# Altium schematic sheet a0206-2006.11.SchDoc
size 558 x 431 mm
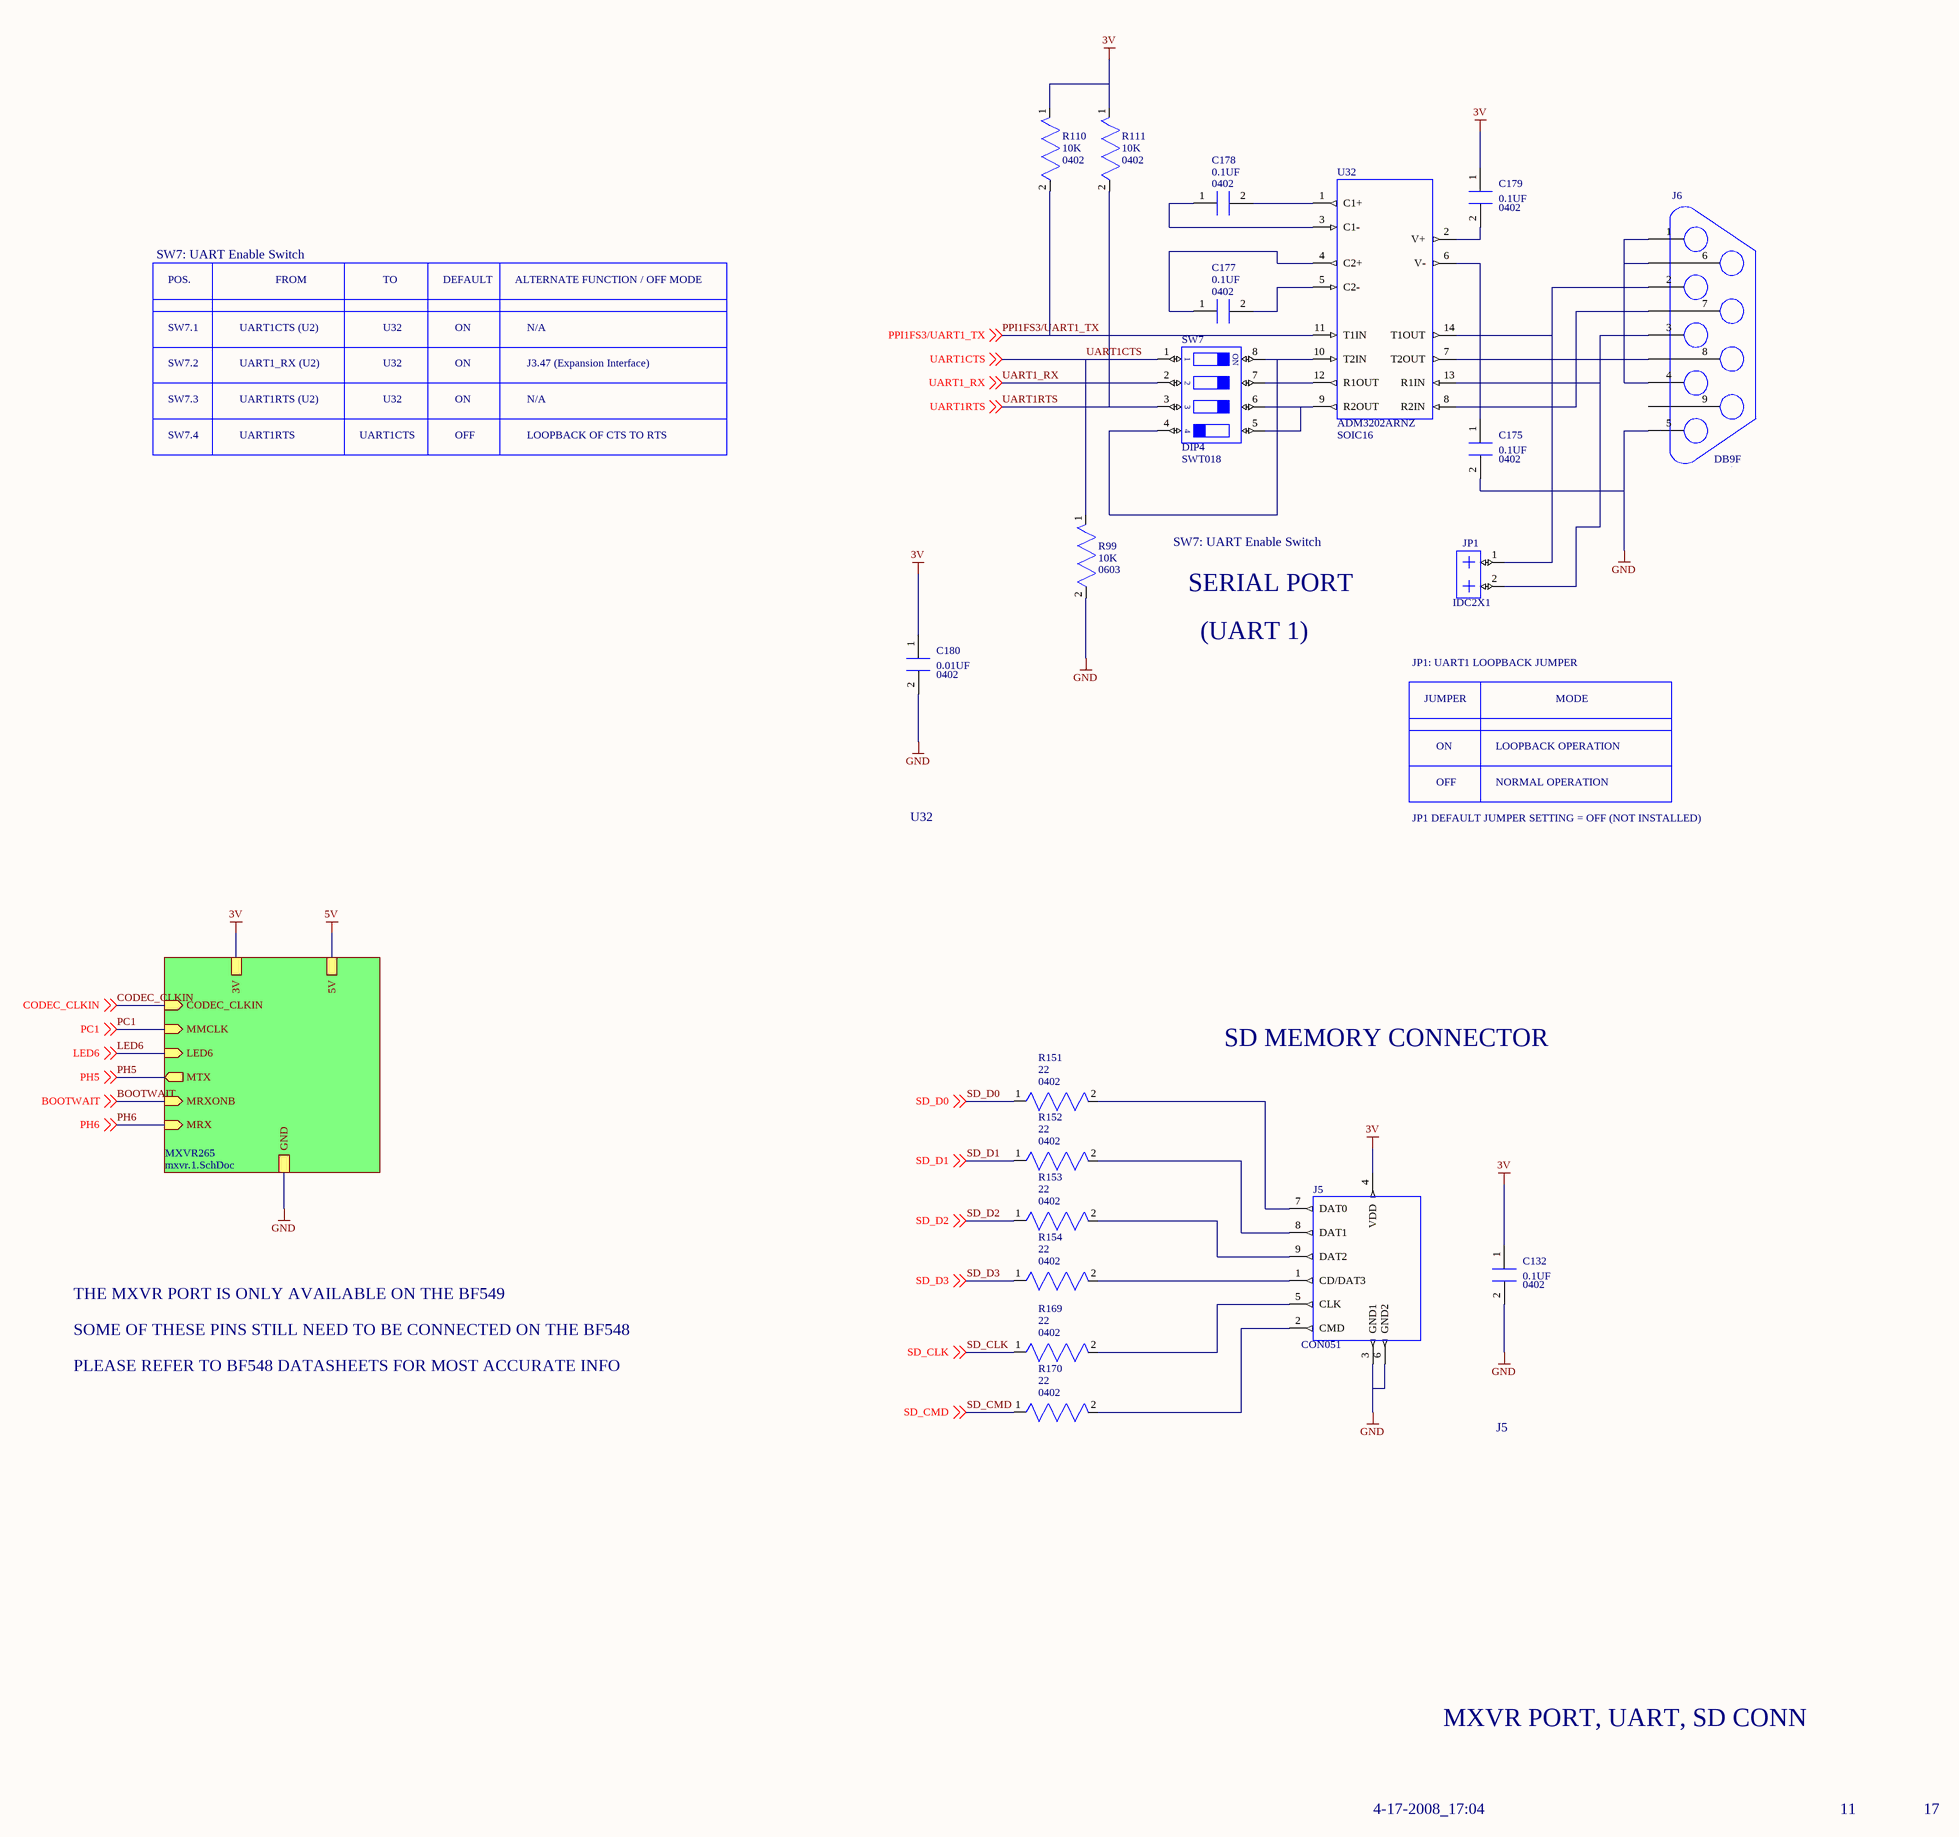
[diagram p0: a0206-2006.11.SchDoc]

## Parts
C132  value 0.1UF  [0402]  (hidden comment: *)
C175  value 0.1UF  [0402]  (hidden comment: *)
C177  value 0.1UF  [0402]  (hidden comment: *)
C178  value 0.1UF  [0402]  (hidden comment: *)
C179  value 0.1UF  [0402]  (hidden comment: *)
C180  value 0.01UF  [0402]  (hidden comment: *)
J5  *  [CON051]  (value not drawn)
J6  *  [DB9F]  (value not drawn)
JP1  *  [IDC2X1]  (value not drawn)
R99  value 10K  [0603]  (hidden comment: *)
R110  value 10K  [0402]  (hidden comment: *)
R111  value 10K  [0402]  (hidden comment: *)
R151  value 22  [0402]  (hidden comment: *)
R152  value 22  [0402]  (hidden comment: *)
R153  value 22  [0402]  (hidden comment: *)
R154  value 22  [0402]  (hidden comment: *)
R169  value 22  [0402]  (hidden comment: *)
R170  value 22  [0402]  (hidden comment: *)
SW7  value DIP4  [SWT018]  (hidden comment: *)
U32  PART: ADM3202ARNZ  [SOIC16]  (hidden comment: *)

## Sub-sheets
MXVR265 = mxvr.1.SchDoc: CODEC_CLKIN (in), GND, LED6 (in), MRX (in), MRXONB (in), MTX (out), MMCLK (in), 3V, 5V

## Nets
3V: C132.1(A) C179.1(A) C180.1(A) J5.4(VDD) R110.1(N1) R111.1(N1) U32.16(3V) ; sheet MXVR265/3V
5V: sheet MXVR265/5V
GND: C132.2(B) C175.2(B) C180.2(B) J5.3(GND1) J5.6(GND2) J6.5 R99.2(N2) U32.15(GND) ; sheet MXVR265/GND
BOOTWAIT: off-sheet BOOTWAIT, sheet MXVR265/MRXONB
CODEC_CLKIN: off-sheet CODEC_CLKIN, sheet MXVR265/CODEC_CLKIN
LED6: off-sheet LED6, sheet MXVR265/LED6
PC1: off-sheet PC1, sheet MXVR265/MMCLK
PH5: off-sheet PH5, sheet MXVR265/MTX
PH6: off-sheet PH6, sheet MXVR265/MRX
PPI1FS3/UART1_TX: R110.2(N2) U32.11(T1IN) ; off-sheet PPI1FS3/UART1_TX
SD_CLK: R169.1(N1) ; off-sheet SD_CLK
SD_CMD: R170.1(N1) ; off-sheet SD_CMD
SD_D0: R151.1(N1) ; off-sheet SD_D0
SD_D1: R152.1(N1) ; off-sheet SD_D1
SD_D2: R153.1(N1) ; off-sheet SD_D2
SD_D3: R154.1(N1) ; off-sheet SD_D3
UART1_RX: SW7.2 ; off-sheet UART1_RX
UART1CTS: R99.1(N1) SW7.1 ; off-sheet UART1CTS
UART1RTS: R111.2(N2) SW7.3 ; off-sheet UART1RTS
NetC175_1: C175.1(A) U32.6(V-)
NetC177_1: C177.1(A) U32.4(C2+)
NetC177_2: C177.2(B) U32.5(C2-)
NetC178_1: C178.1(A) U32.3(C1-)
NetC178_2: C178.2(B) U32.1(C1+)
NetC179_2: C179.2(B) U32.2(V+)
NetJ5_1: J5.1(CD/DAT3) R154.2(N2)
NetJ5_2: J5.2(CMD) R170.2(N2)
NetJ5_5: J5.5(CLK) R169.2(N2)
NetJ5_7: J5.7(DAT0) R151.2(N2)
NetJ5_8: J5.8(DAT1) R152.2(N2)
NetJ5_9: J5.9(DAT2) R153.2(N2)
NetJ6_1: J6.1 J6.4 J6.6
NetJ6_2: J6.2 JP1.1 U32.14(T1OUT)
NetJ6_3: J6.3 JP1.2 U32.13(R1IN)
NetJ6_7: J6.7 U32.8(R2IN)
NetJ6_8: J6.8 U32.7(T2OUT)
NetSW7_4: SW7.4 SW7.8 U32.10(T2IN)
NetSW7_5: SW7.5 SW7.6 U32.9(R2OUT)
NetSW7_7: SW7.7 U32.12(R1OUT)

Not connected (* = marked no-connect by the designer): J6 9

## Notes on the sheet
- SW7: UART Enable Switch
- POS.
- SW7.1
- UART1CTS (U2)
- FROM
- U32
- TO
- DEFAULT
- ON
- ALTERNATE FUNCTION / OFF MODE
- N/A
- SW7.2
- UART1_RX (U2)
- J3.47 (Expansion Interface)
- SW7.3
- SW7.4
- UART1RTS (U2)
- UART1RTS
- UART1CTS
- OFF
- LOOPBACK OF CTS TO RTS
- SERIAL PORT
- (UART 1)
- JP1: UART1 LOOPBACK JUMPER
- JUMPER
- LOOPBACK OPERATION
- MODE
- NORMAL OPERATION
- JP1 DEFAULT JUMPER SETTING = OFF (NOT INSTALLED)
- SD MEMORY CONNECTOR
- THE MXVR PORT IS ONLY AVAILABLE ON THE BF549
- SOME OF THESE PINS STILL NEED TO BE CONNECTED ON THE BF548
- PLEASE REFER TO BF548 DATASHEETS FOR MOST ACCURATE INFO
- J5
- MXVR PORT, UART, SD CONN
- 4-17-2008_17:04
- 11
- 17
- A
- B
- C
- D
- 1
- 2
- 3
- 20 Cotton Road
- 4
- DEVICES
- ANALOG
- Nashua, NH 03063
- PH: 1-800-ANALOGD
- Title
- ADSP-BF548 EZ-KIT LITE
- Size
- Board No.
- A0206-2006
- Rev
- 1.4B
- Date
- Sheet
- of
- (in symbol SW_DIP4.1) ON

## Library data of the parts
C132 = CAP_NON_POLARIZED.2: PART_SPEC: CAPACITOR; LEVEL: STD; TOLERANCE: 10%; VOLTAGE: 10V; PRT_NUM: 7000278; BOARDS: BOTH; TYPE: X5R; PKG_TYPE: 0402; ROHS: ROHS
C175 = CAP_NON_POLARIZED.2: PART_SPEC: CAPACITOR; LEVEL: STD; TYPE: X5R; BOARDS: BOTH; TOLERANCE: 10%; VOLTAGE: 10V; PRT_NUM: 7000278; PKG_TYPE: 0402; ROHS: ROHS
C177 = CAP_NON_POLARIZED.1: PART_SPEC: CAPACITOR; LEVEL: STD; TYPE: X5R; BOARDS: BOTH; TOLERANCE: 10%; VOLTAGE: 10V; PRT_NUM: 7000278; PKG_TYPE: 0402; ROHS: ROHS
C178 = CAP_NON_POLARIZED.1: PART_SPEC: CAPACITOR; LEVEL: STD; TYPE: X5R; BOARDS: BOTH; PRT_NUM: 7000278; VOLTAGE: 10V; TOLERANCE: 10%; PKG_TYPE: 0402; ROHS: ROHS
C179 = CAP_NON_POLARIZED.2: PART_SPEC: CAPACITOR; LEVEL: STD; TYPE: X5R; BOARDS: BOTH; PRT_NUM: 7000278; VOLTAGE: 10V; TOLERANCE: 10%; PKG_TYPE: 0402; ROHS: ROHS
C180 = CAP_NON_POLARIZED.2: PART_SPEC: CAPACITOR; LEVEL: STD; TYPE: X7R; BOARDS: BOTH; PRT_NUM: 7000279; VOLTAGE: 16V; TOLERANCE: 10%; PKG_TYPE: 0402; ROHS: ROHS
J5 = CON_SD.1: SECURE DIGITAL CARD READE; PART_SPEC: CONNECTOR; LEVEL: STD; CONFIGURATION: 9PIN; PRT_NUM: 6000826; PKG_TYPE: CON051; ROHS: ROHS; TYPE: SD_CONN
J6 = CON_DB9.1: RIGHT ANGLE FEMALE; LEVEL: STD; PRT_NUM: 6000146; CONFIGURATION: 9PIN; PKG_TYPE: DB9F; TYPE: DB9; ROHS: ROHS
JP1 = CON_JP_2X1.1: HEADER; PART_SPEC: CONNECTOR; LEVEL: STD; BOARDS: BOTH; PRT_NUM: 6000774; CONFIGURATION: 2X1; PKG_TYPE: IDC2X1; TYPE: IDC; ROHS: ROHS
R99 = RES_STANDARD.2: PART_SPEC: RESISTOR; LEVEL: STD; POWER: 1/10W; BOARDS: KIT; PRT_NUM: 7000364; TOLERANCE: 5%; PKG_TYPE: 0603; ROHS: ROHS
R110 = RES_STANDARD.2: PART_SPEC: RESISTOR; LEVEL: STD; POWER: 1/16W; BOARDS: BOTH; TOLERANCE: 5%; PRT_NUM: 7000280; PKG_TYPE: 0402; ROHS: ROHS
R111 = RES_STANDARD.2: PART_SPEC: RESISTOR; LEVEL: STD; PRT_NUM: 7000280; TOLERANCE: 5%; BOARDS: BOTH; POWER: 1/16W; PKG_TYPE: 0402; ROHS: ROHS
R151 R153 R170 = RES_STANDARD.1: PART_SPEC: RESISTOR; LEVEL: STD; PRT_NUM: 7000284; POWER: 1/16W; TOLERANCE: 5%; PKG_TYPE: 0402; ROHS: ROHS
R152 R154 R169 = RES_STANDARD.1: PART_SPEC: RESISTOR; LEVEL: STD; TOLERANCE: 5%; POWER: 1/16W; PRT_NUM: 7000284; PKG_TYPE: 0402; ROHS: ROHS
SW7 = SW_DIP4.1: 4PIN-SMT-SWT; PART_SPEC: SWITCH; LEVEL: STD; BOARDS: BOTH; PRT_NUM: 6000144; PKG_TYPE: SWT018; ROHS: ROHS
U32 = ICS_ADM232AARN.1: RS232 INTERFACE; LEVEL: STD; BOARDS: BOTH; PRT_NUM: 30-025205-01; PKG_TYPE: SOIC16; ROHS: ROHS; WEB: http://www.analog.com/en/prod/0%2C2877%2CADM3202%2C00.html